# Altium schematic sheet USB-SIM-Connector-Sheet.SchDoc
size 420 x 297 mm; SheetNumber: 1; SheetTotal: 1
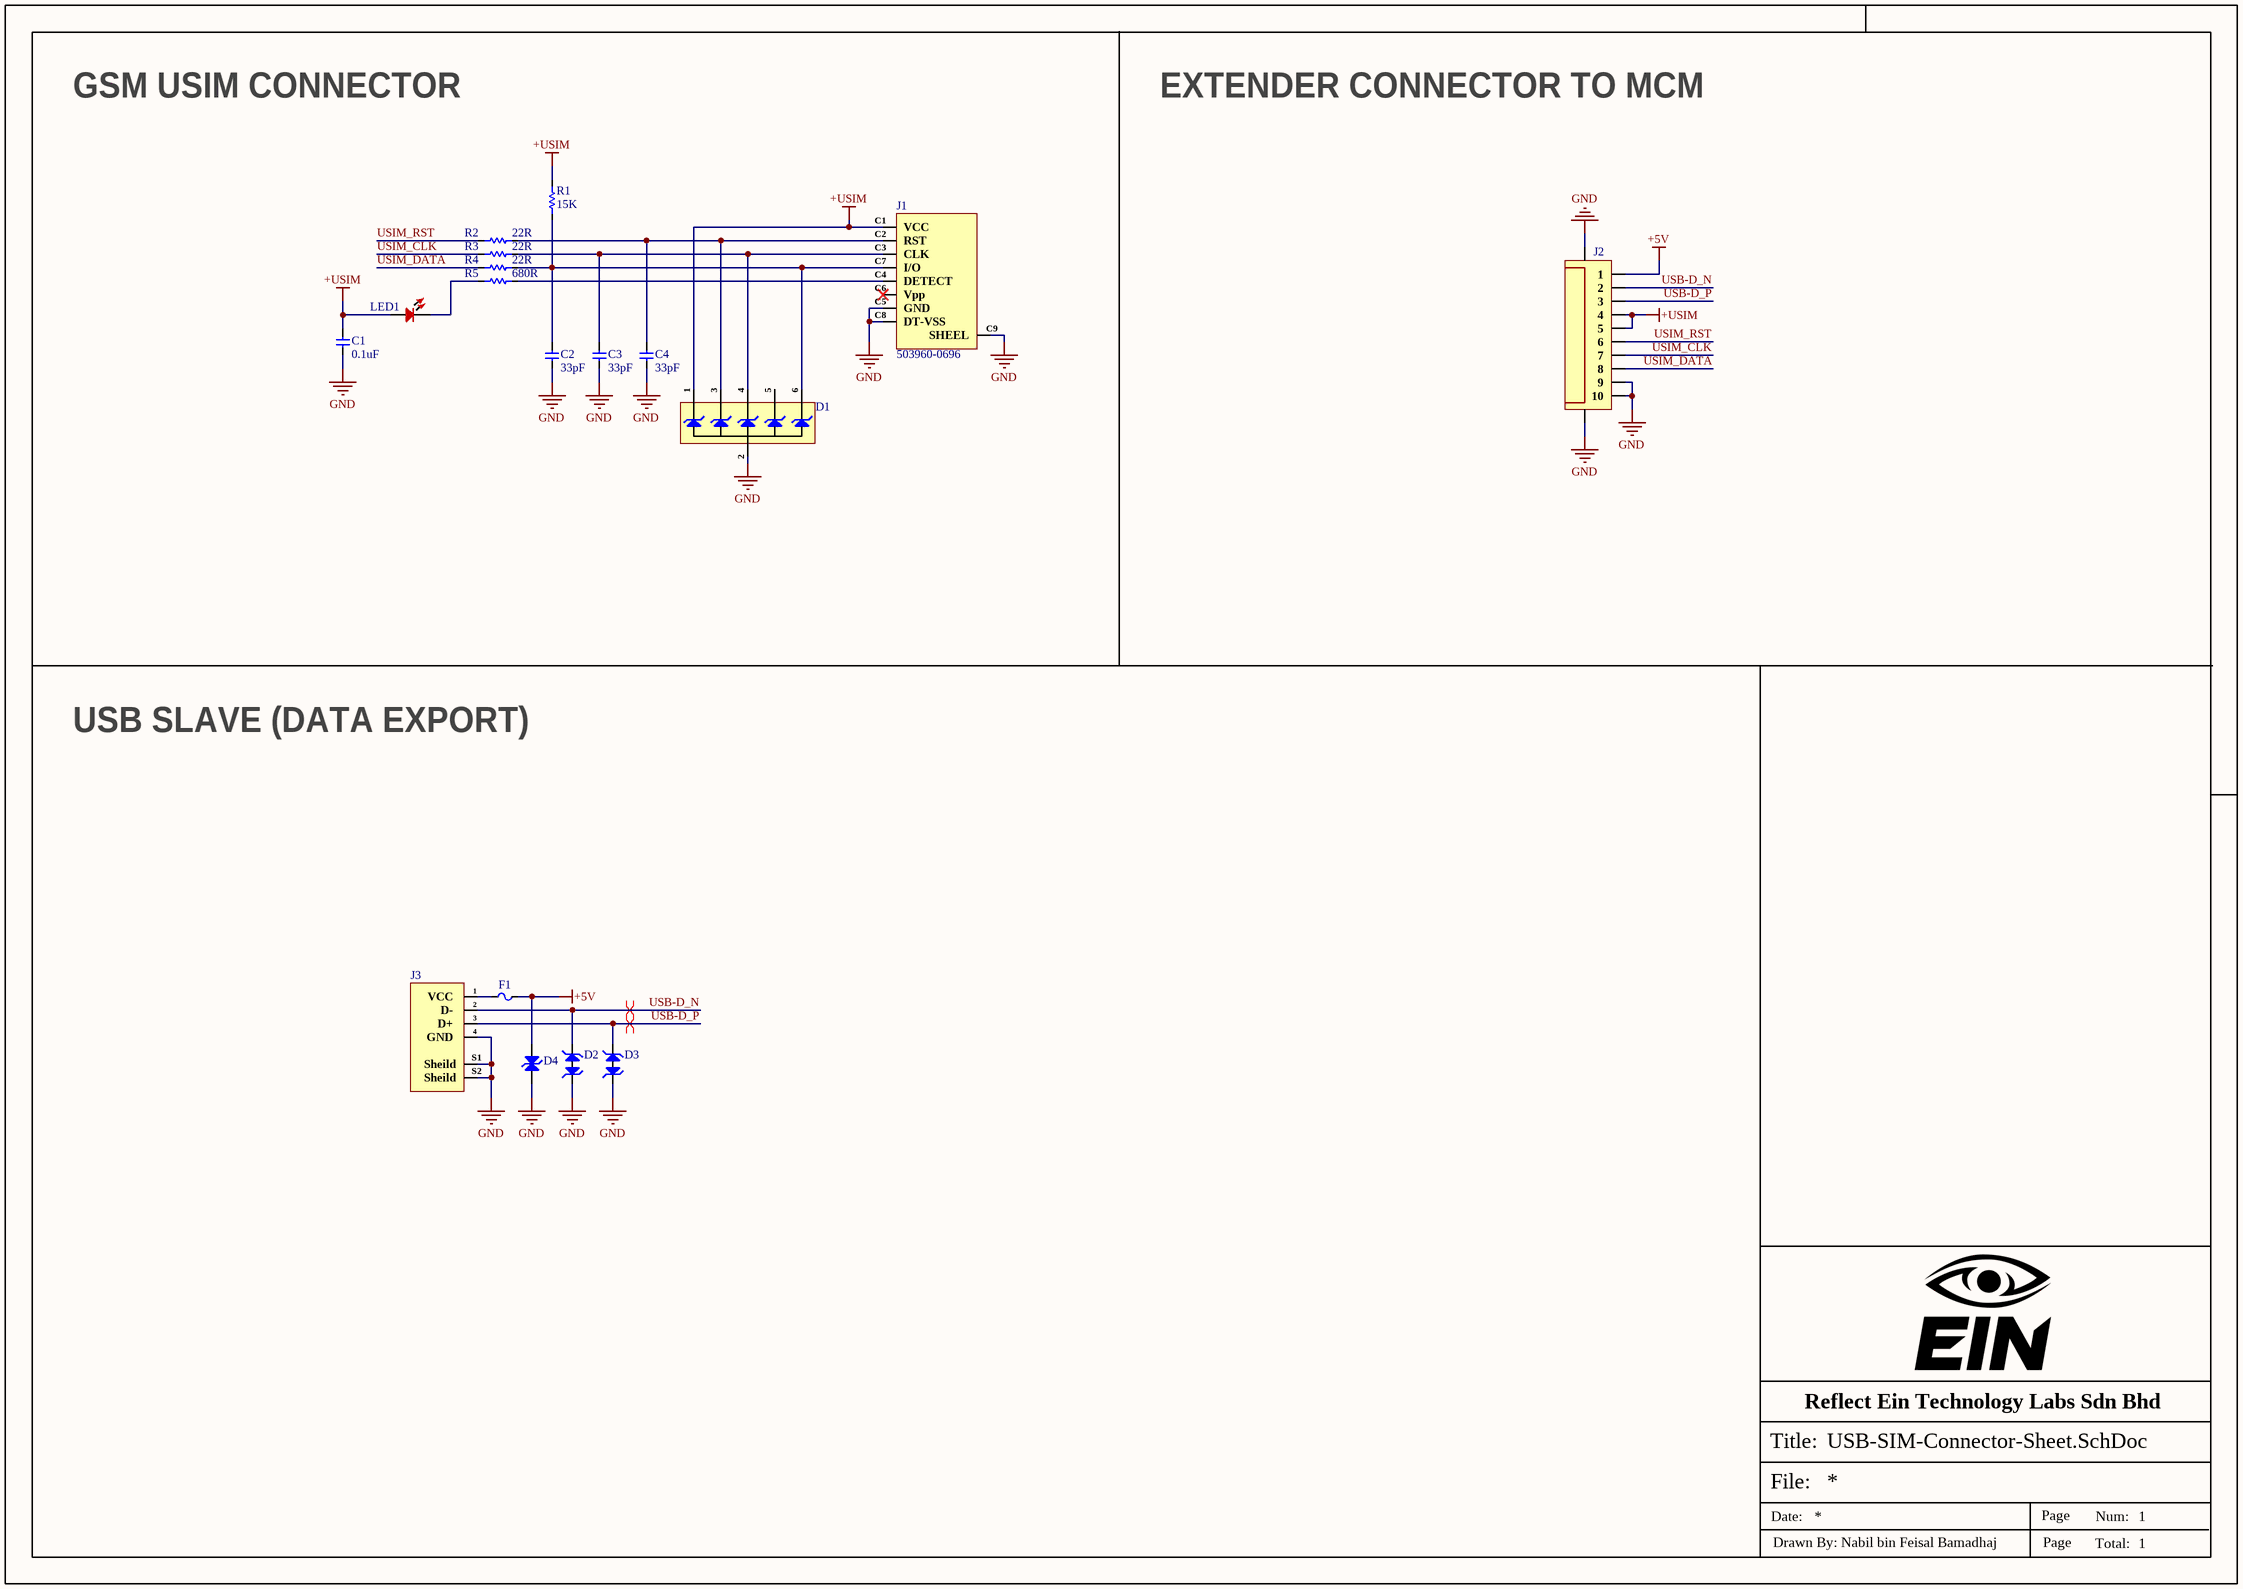
[diagram p0: USB-SIM-Connector-Sheet.SchDoc]

## Parts
C1  0.1uF  [Cap-0603]
C2  33pF  [Cap-0603]
C3  33pF  [Cap-0603]
C4  33pF  [Cap-0603]
D1  ESDA6V8AV6  [SOT-563]  (value not drawn)
D2  ESD9B5VL  [DFN1006-2L (Bi-Directional)]  (value not drawn)
D3  ESD9B5VL  [DFN1006-2L (Bi-Directional)]  (value not drawn)
D4  SLESD5451X  [DFN1006-2L (Bi-Directional)]  (value not drawn)
F1  SMD0805B035TF  [Fuse-0805]  (value not drawn)
J1  503960-0696  [5039600696]
J2  HX0.5-10P XJH2.0 043  [HX0.5-10P XJH2.0 043]  (value not drawn)
J3  USB-234-BCW  [USB-234-BCW]  (value not drawn)
LED1  RED  [LED-0603]  (value not drawn)
R1  15K  [Res-0603]
R2  22R  [Res-0603]
R3  22R  [Res-0603]
R4  22R  [Res-0603]
R5  680R  [Res-0603]

## Nets
+5V: D4.2(A) F1.2 J2.1
+USIM: C1.2 D1.1(K) J1.C1(VCC) J2.4 J2.5 LED1.1 R1.2
GND: C1.1 C2.1 C3.1 C4.1 D1.2(A) D2.1(K) D3.1(K) D4.1(A) J1.C5(GND) J1.C8(DT-VSS) J1.C9(SHEEL) J2.9 J2.10 J2.MP1 J2.MP2 J3.4(GND) J3.S1(Sheild) J3.S2(Sheild)
USB-D_N: D2.2(K) J2.2 J3.2(D-)
USB-D_P: D3.2(K) J2.3 J3.3(D+)
USIM_CLK: J2.7 R3.1
USIM_DATA: J2.8 R4.1
USIM_RST: J2.6 R2.1
NetC2_2: C2.2 D1.6(K) J1.C7(I/O) R1.1 R4.2
NetC3_2: C3.2 D1.4(K) J1.C3(CLK) R3.2
NetC4_2: C4.2 D1.3(K) J1.C2(RST) R2.2
NetF1_1: F1.1 J3.1(VCC)
NetJ1_C4: J1.C4(DETECT) R5.2
NetLED1_2: LED1.2 R5.1

Not connected (* = marked no-connect by the designer): D1 5(K); J1 C6(Vpp)*

## Layout directives
differential pair; differential pair class DIFF_USB: USB-D_N
differential pair: USB-D_P

## Notes on the sheet
- GSM USIM CONNECTOR
- EXTENDER CONNECTOR TO MCM
- USB SLAVE (DATA EXPORT)
- Reflect Ein Technology Labs Sdn Bhd
- File:
- Title:
- Date:
- Page
- Num:
- Total:
- Drawn By: Nabil bin Feisal Bamadhaj

## Library data of the parts
C1 = GCJ188R71H104KA12D: CAP CER 0.1UF 50V X7R 0603; Manufacturer: Murata; Item Type: Capacitors; Material: 4241ConductorMaterial; Value: 100nF; Tolerance: 10%; Supplier: Mouser; LCSC Part Number: C161115; Manufacturer Part Number: GCJ188R71H104KA12D; RoHS: Yes; Stock: 342536; Pricing: 1=0.13, 10=0.056, 50=0.056, 100=0.036, 1000=0.032, 10000=0.02 (USD); Mounting Technology: Surface Mount; Case/Package: 0603; Case Code (Metric): 1608; Case Code (Imperial): 0603; Min Operating Temperature: -55°C; Max Operating Temperature: 125°C; Dielectric: X7R; Package Quantity: 1; Voltage Rating: 50V; Packaging: Tape and Reel; Voltage Rating (DC): 50V; Termination: SMD/SMT; Features: Soft Termination; Series: GCJ; Construction: Flat; Length: 1.6mm; Width: 0.031inch; Height: 0.8mm; Thickness: 0.035inch; Depth: 0.8mm; Ratings: AEC-Q200; Radiation Hardening: No; RoHS Compliant: Yes; Lead Free: 5697LeadFree; ComponentLink1URL: https://datasheet.ciiva.com/135/product-135604.pdf?src-supplier=Digikey; ComponentLink1Description: https://datasheet.ciiva.com/135/product-135604.pdf?src-supplier=Digikey; ComponentLink2URL: https://datasheet.ciiva.com/26889/getdatasheetpartid-369886-26889118.pdf?src-supplier=Verical; ComponentLink2Description: https://datasheet.ciiva.com/26889/getdatasheetpartid-369886-26889118.pdf?src-supplier=Verical; ComponentLink3URL: https://datasheet.ciiva.com/135/s0717e-135605.pdf?src-supplier=Digikey; ComponentLink3Description: https://datasheet.ciiva.com/135/s0717e-135605.pdf?src-supplier=Digikey; ComponentLink4URL: https://datasheet.ciiva.com/135/s0717e-135606.pdf?src-supplier=Digikey; ComponentLink4Description: https://datasheet.ciiva.com/135/s0717e-135606.pdf?src-supplier=Digikey; ComponentLink5URL: https://datasheet.ciiva.com/16440/c03e-16440425.pdf?src-supplier=Future+Electronics; ComponentLink5Description: https://datasheet.ciiva.com/16440/c03e-16440425.pdf?src-supplier=Future+Electronics
C2-C4 = GCM1885C2A330JA16D: CAP CER 33PF 100V C0G/NP0 0603; Manufacturer: Murata; Item Type: Capacitors; Tolerance: 5%; Dielectric: C0G; Supplier: Mouser; LCSC Part Number: C126578; Manufacturer Part Number: GCM1885C2A330JA16D; RoHS: Yes; Stock: 24199; Pricing: 1=0.1, 10=0.03, 50=0.03, 100=0.022, 1000=0.017, 10000=0.011 (USD); Mounting Technology: Surface Mount; Case/Package: 0603; Case Code (Imperial): 0603; Case Code (Metric): 1608; Min Operating Temperature: -55°C; Max Operating Temperature: 125°C; Value: 33pF; Package Quantity: 1; Packaging: Tape and Reel; Voltage Rating: 100V; Voltage Rating (DC): 100V; Termination: SMD/SMT; Series: GCM; Construction: Flat; Length: 1.6mm; Width: 0.031inch; Height: 0.8mm; Thickness: 0.035inch; Depth: 0.8mm; Ratings: AEC-Q200; Radiation Hardening: No; RoHS Compliant: Yes; ComponentLink1URL: https://datasheet.ciiva.com/161/product-161815.pdf?src-supplier=Digikey; ComponentLink1Description: https://datasheet.ciiva.com/161/product-161815.pdf?src-supplier=Digikey; ComponentLink2URL: https://datasheet.ciiva.com/161/product-161814.pdf?src-supplier=Digikey; ComponentLink2Description: https://datasheet.ciiva.com/161/product-161814.pdf?src-supplier=Digikey; ComponentLink3URL: https://datasheet.ciiva.com/161/product-161816.pdf?src-supplier=Digikey; ComponentLink3Description: https://datasheet.ciiva.com/161/product-161816.pdf?src-supplier=Digikey; ComponentLink4URL: https://datasheet.ciiva.com/11606/product-11606732.pdf?src-supplier=Avnet; ComponentLink4Description: https://datasheet.ciiva.com/11606/product-11606732.pdf?src-supplier=Avnet
D1 = ESDA6V8AV6: 4A 14V 40W 6V Unidirectional 5V SOT-563 ESD and Surge Protection (TVS/ESD) ROHS; Manufacturer: TECH PUBLIC; Manufacturer Part Number: ESDA6V8AV6; Package: SOT-563; LCSC Part Number: C3021131; Item Type: (TVS/ESD); ComponentLink1Description: LCSC; ComponentLink1URL: https://www.lcsc.com/product-detail/ESD-and-Surge-Protection-TVS-ESD_TECH-PUBLIC-ESDA6V8AV6_C3021131.html?s_z=n_ESDA6V8AV6
D2 D3 = ESD9B5VL: 3A 35W 12V 5.6V Bidirectional 5V DFN1006 ESD and Surge Protection (TVS/ESD) ROHS; Manufacturer: TECH PUBLIC; Manufacturer Part Number: ESD9B5VL; Package: DFN1006; LCSC Part Number: C2827544; Item Type: (TVS/ESD); ComponentLink1Description: LCSC; ComponentLink1URL: https://www.lcsc.com/product-detail/ESD-and-Surge-Protection-TVS-ESD_TECH-PUBLIC-ESD9B5VL_C2827544.html?s_z=n_ESD9B5VL
D4 = SLESD5451X: 60W 5.6V Bidirectional 5V DFN1006 ESD and Surge Protection (TVS/ESD) ROHS; Manufacturer: Slkor(SLKORMICRO Elec.); Manufacturer Part Number: SLESD5451X; Package: DFN1006; LCSC Part Number: C5185982; Item Type: TVS/ESD; ComponentLink1Description: LCSC; ComponentLink1URL: https://www.lcsc.com/product-detail/ESD-and-Surge-Protection-TVS-ESD_Slkor-SLKORMICRO-Elec-SLESD5451X_C5185982.html?s_z=n_SLESD5451X
F1 = SMD0805B035TF: 6V 350mA 100A 750mA 0805 Resettable Fuses ROHS; Manufacturer: Brightking; Manufacturer Part Number: SMD0805B035TF; Package: 0805; LCSC Part Number: C269103; Item Type: Resettable Fuses; ComponentLink1Description: LCSC; ComponentLink1URL: https://www.lcsc.com/product-detail/Resettable-Fuses_Brightking-SMD0805B035TF_C269103.html?s_z=n_SMD0805B035TF
J1 = 503960-0696: CONN MICRO SIMM PUSH-PUSH R/A; Manufacturer: Molex; Item Type: Memory Connectors; Plating: Gold; Current Rating: 500mA; Number of Circuits: 6; Number of Contacts: 8; Voltage Rating: 10V; Supplier: Arrow Electronics; LCSC Part Number: C132719; Manufacturer Part Number: 503960-0696; RoHS: Yes; Stock: 4105; Pricing: 1=1.7339, 10=1.4783, 25=1.4697, 50=1.441, 100=1.3312, 250=1.3227, 500=1.2003, 1600=1.1948, 3200=1.1943 (USD); Contact Material: Nickel,Gold; Contact Plating: Gold; Housing Material: Stainless Steel; Min Operating Temperature: -25°C; Max Operating Temperature: 85°C; Height: 1.5mm; RoHS Compliant: Yes; ComponentLink1URL: http://datasheet.octopart.com/5039600696-Molex-datasheet-148167723.pdf?src-supplier=Rs; ComponentLink1Description: http://datasheet.octopart.com/5039600696-Molex-datasheet-148167723.pdf?src-supplier=Rs; ComponentLink2URL: http://datasheet.octopart.com/5039600696-Molex-datasheet-148167723.pdf?src-supplier=Farnell; ComponentLink2Description: http://datasheet.octopart.com/5039600696-Molex-datasheet-148167723.pdf?src-supplier=Farnell; ComponentLink3URL: http://datasheet.octopart.com/5039600696-Molex-datasheet-148167723.pdf?src-supplier=Avnet; ComponentLink3Description: http://datasheet.octopart.com/5039600696-Molex-datasheet-148167723.pdf?src-supplier=Avnet; ComponentLink4URL: http://datasheet.octopart.com/5039600696-Molex-datasheet-148167723.pdf?src-supplier=Arrow+Electronics; ComponentLink4Description: http://datasheet.octopart.com/5039600696-Molex-datasheet-148167723.pdf?src-supplier=Arrow+Electronics; ComponentLink5URL: http://datasheet.octopart.com/5039600696-Molex-datasheet-148167723.pdf?src-supplier=Onlinecomponents.com; ComponentLink5Description: http://datasheet.octopart.com/5039600696-Molex-datasheet-148167723.pdf?src-supplier=Onlinecomponents.com; ComponentLink6URL: http://datasheet.octopart.com/5039600696-Molex-datasheet-148167723.pdf?src-supplier=Verical; ComponentLink6Description: http://datasheet.octopart.com/5039600696-Molex-datasheet-148167723.pdf?src-supplier=Verical; ComponentLink7URL: http://datasheet.octopart.com/5039600696-Molex-datasheet-148167723.pdf?src-supplier=Electro+Sonic; ComponentLink7Description: http://datasheet.octopart.com/5039600696-Molex-datasheet-148167723.pdf?src-supplier=Electro+Sonic
J2 = HX0.5-10P XJH2.0 043: Flip type 10P Bottom Contact Horizontal attachment 0.5mm SMD,P=0.5mm FFC, FPC (Flat Flexible) Connector Assemblies ROHS; Manufacturer: hanxia; Item Type: FFC/FPC Cable; Manufacturer Part Number: HX0.5-10P XJH2.0 043; Package: SMD,P=0.5mm; LCSC Part Number: C5691101; ComponentLink1Description: LCSC; ComponentLink1URL: https://www.lcsc.com/product-detail/FFC-FPC-Flat-Flexible-Connector-Assemblies_hanxia-HX0-5-10P-XJH2-0-043_C5691101.html?s_z=n_HX0.5-10P%20XJH2.0%20043
J3 = USB-234-BCW: 1.5A USB 2.0 1 Horizontal attachment 4P Female -20℃~+70℃ Type-A SMD USB Connectors ROHS; Manufacturer: XUNPU; Manufacturer Part Number: USB-234-BCW; Package: SMD; LCSC Part Number: C720528; Item Type: USB Connector; ComponentLink1Description: LCSC; ComponentLink1URL: https://www.lcsc.com/product-detail/USB-Connectors_XUNPU-USB-234-BCW_C720528.html?s_z=n_USB-234-BCW
LED1 = NCD0603R3: RED LED 0603 Light Emitting Diodes; Manufacturer: Foshan NationStar Optoelectronics; Manufacturer Part Number: NCD0603R3; Package: 0603; Item Type: LED; LCSC Part Number: C3151730; ComponentLink1Description: LCSC; ComponentLink1URL: https://www.lcsc.com/product-detail/Light-Emitting-Diodes-LED_Foshan-NationStar-Optoelectronics-NCD0603R3_C3151730.html
R1 = RC0603FR-0715KL: RES 15K OHM 1% 1/10W 0603; Manufacturer: Yageo; Temperature Coefficient: 100ppm/°C; Value: 15kR; Power Rating: 100mW; Voltage Rating (DC): 50V; Item Type: Resistor; Supplier 1: Future Electronics; Manufacturer Part Number: RC0603FR-0715KL; RoHS: Yes; Category: Chip SMD Resistors; Stock 1: 13310000; Pricing 1: 5000=0.00150, 50000=0.00140, 100000=0.00140, 200000=0.00140, 375000=0.00140, 625000=0.00130, 1000000=0.00130, 2000000=0.00120, 3750000=0.00120 (USD); Case/Package: 0603; Pins: 2; Case Code (Metric): 1608; Case Code (Imperial): 0603; Min Operating Temperature: -55°C; Max Operating Temperature: 155°C; Tolerance: 1%; Packaging: Tape and Reel; Resistor Type: Thick Film; Series: RC; Package Quantity: 1; Voltage Rating: 50V; Number of Terminations: 2; Termination: SMD/SMT; Max Power Dissipation: 100mW; Features: Moisture Resistant; Resistance Tolerance: 1%; Construction: Rectangular; Length: 0.063inch; Width: 0.031inch; Height: 0.022inch; Depth: 0.8mm; Lead Free: Lead Free; RoHS Compliant: Yes; Military Standard: Not; Supplier Part Number 1: 4083945; LCSC Part Number: C114661
R2-R4 = RC0603FR-0722RL: RES 22 OHM 1% 1/10W 0603; Manufacturer: Yageo; Temperature Coefficient: 100ppm/°C; Voltage Rating (DC): 50V; Power Rating: 100mW; Item Type: Resistor; Supplier 1: Avnet; Manufacturer Part Number: RC0603FR-0722RL; RoHS: Yes; Category: Chip SMD Resistors; Stock 1: 190000; Pricing 1: 5000=0.00133, 10000=0.00131, 20000=0.00127 (USD); Case/Package: 0603; Number of Pins: 2; Case Code (Metric): 1608; Case Code (Imperial): 0603; Size Code: 0603; Min Operating Temperature: -55°C; Max Operating Temperature: 155°C; Tolerance: 1%; Resistance: 22R; Resistor Type: Thick Film; Packaging: Tape and Reel; Voltage Rating: 50V; Package Quantity: 1; Number of Terminations: 2; Termination: SMD/SMT; Max Power Dissipation: 100mW; Features: Moisture Resistant; Series: RC; Resistance Tolerance: 1%; Technology: THICK FILM; Construction: Rectangular; Length: 0.063inch; Width: 0.031inch; Height: 0.022inch; Depth: 0.8mm; Reach SVHC Compliant: Yes; Lead Free: Lead Free; Military Standard: Not; RoHS Compliant: Yes; ComponentLink1URL: https://datasheet.ciiva.com/11819/0900766b80f96399-11819285.pdf?src-supplier=RSComponents; ComponentLink1Description: https://datasheet.ciiva.com/11819/0900766b80f96399-11819285.pdf?src-supplier=RSComponents; ComponentLink2URL: https://datasheet.ciiva.com/46395/443971-46395032.pdf?src-supplier=Element14; ComponentLink2Description: https://datasheet.ciiva.com/46395/443971-46395032.pdf?src-supplier=Element14; ComponentLink3URL: https://datasheet.ciiva.com/46440/1868787-46440901.pdf?src-supplier=Element14; ComponentLink3Description: https://datasheet.ciiva.com/46440/1868787-46440901.pdf?src-supplier=Element14; ComponentLink4URL: https://datasheet.ciiva.com/2454/pyu-r-int-thick-7-2454355.pdf?src-supplier=Digi-Key; ComponentLink4Description: https://datasheet.ciiva.com/2454/pyu-r-int-thick-7-2454355.pdf?src-supplier=Digi-Key; ComponentLink5URL: https://datasheet.ciiva.com/2454/pyu-r-int-thick-7-2454356.pdf?src-supplier=Digi-Key; ComponentLink5Description: https://datasheet.ciiva.com/2454/pyu-r-int-thick-7-2454356.pdf?src-supplier=Digi-Key; ComponentLink6URL: https://datasheet.ciiva.com/2454/pyu-r-int-thick-7-2454354.pdf?src-supplier=Digi-Key; ComponentLink6Description: https://datasheet.ciiva.com/2454/pyu-r-int-thick-7-2454354.pdf?src-supplier=Digi-Key; Supplier Part Number 1: RC0603FR-0722RL; LCSC Part Number: C107701
R5 = RC0603FR-07680RL: RES SMD 680 OHM 1% 1/10W 0603; Manufacturer: Yageo; Item Type: Resistor; Manufacturer Part Number: RC0603FR-07680RL; Package: 0603; ComponentLink4URL: https://www.lcsc.com/product-detail/Chip-Resistor-Surface-Mount_YAGEO-RC0603FR-07680RL_C112310.html; ComponentLink4Description: LCSC; LCSC Part Number: C112310